# Altium schematic sheet 21_IMU.SchDoc
size A4; SheetNumber: 3; SheetTotal: 16
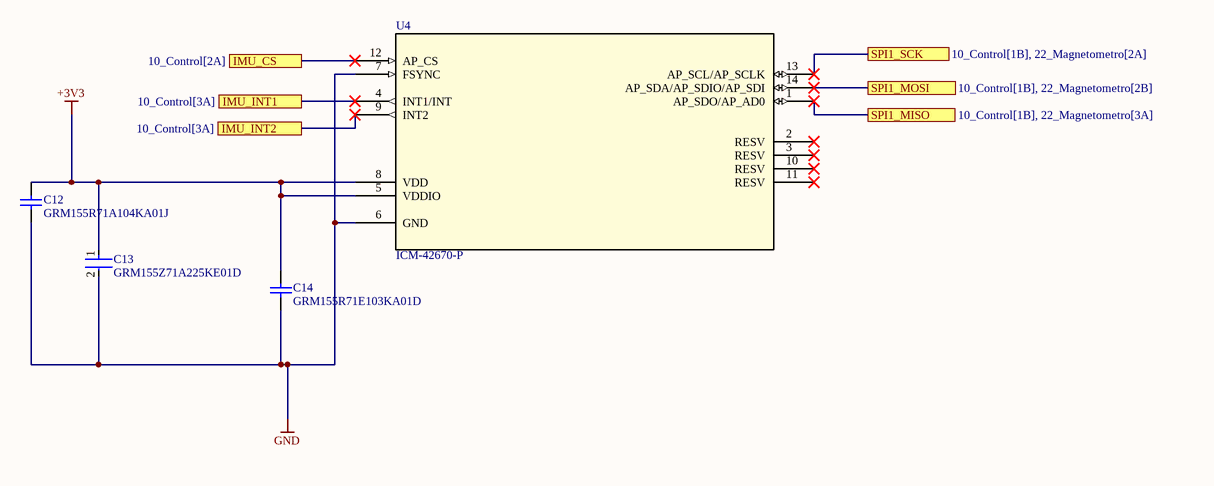
[diagram p0: 21_IMU.SchDoc]

## Parts
C12  GRM155R71A104KA01J  [CAPC1005X55X25ML05T10]
C13  GRM155Z71A225KE01D  [FP-GRM155-0_15-IPC_A]
C14  GRM155R71E103KA01D  [CAPC1005X55X25LL05T10]
U4  ICM-42670-P  [LGA14_2.5X3X0.76_IVS]

## Ports
IMU_CS (see 10_Control[2A]), IMU_INT1 (see 10_Control[3A]), IMU_INT2 (see 10_Control[3A]), SPI1_MISO (see 10_Control[1B], 22_Magnetometro[3A]), SPI1_MOSI (see 10_Control[1B], 22_Magnetometro[2B]), SPI1_SCK (see 10_Control[1B], 22_Magnetometro[2A])

## Nets
+3V3: C12.2 C13.1 C14.2 U4.5(VDDIO) U4.8(VDD)
GND: C12.1 C13.2 C14.1 U4.6(GND) U4.7(FSYNC)
IMU_CS: U4.12(AP_CS) ; port IMU_CS
IMU_INT1: U4.4(INT1/INT) ; port IMU_INT1
IMU_INT2: U4.9(INT2) ; port IMU_INT2
SPI1_MISO: U4.1(AP_SDO/AP_AD0) ; port SPI1_MISO
SPI1_MOSI: U4.14(AP_SDA/AP_SDIO/AP_SDI) ; port SPI1_MOSI
SPI1_SCK: U4.13(AP_SCL/AP_SCLK) ; port SPI1_SCK

Not connected (* = marked no-connect by the designer): U4 2(RESV)* 3(RESV)* 10(RESV)* 11(RESV)*

## Library data of the parts
C12 = CMP-2008-04031-1: Manufacturer: Murata; Part Number: GRM155R71A104KA01J
C13 = CMP-06035-048202-1: Chip Multilayer Ceramic Capacitors for General Purpose, 0402, 2.2uF, X7R, 15%, 10%, 10V
C14 = CMP-1034-01880-2: Manufacturer: Murata; Part Number: GRM155R71E103KA01D
U4 = ICM-42670-P: Description; Manufacturer_Name: TDK; Copyright: Copyright (C) 2026 Ultra Librarian. All rights reserved.; Manufacturer_Part_Number: ICM-42670-P; RefDes: RefDes; Type: Type